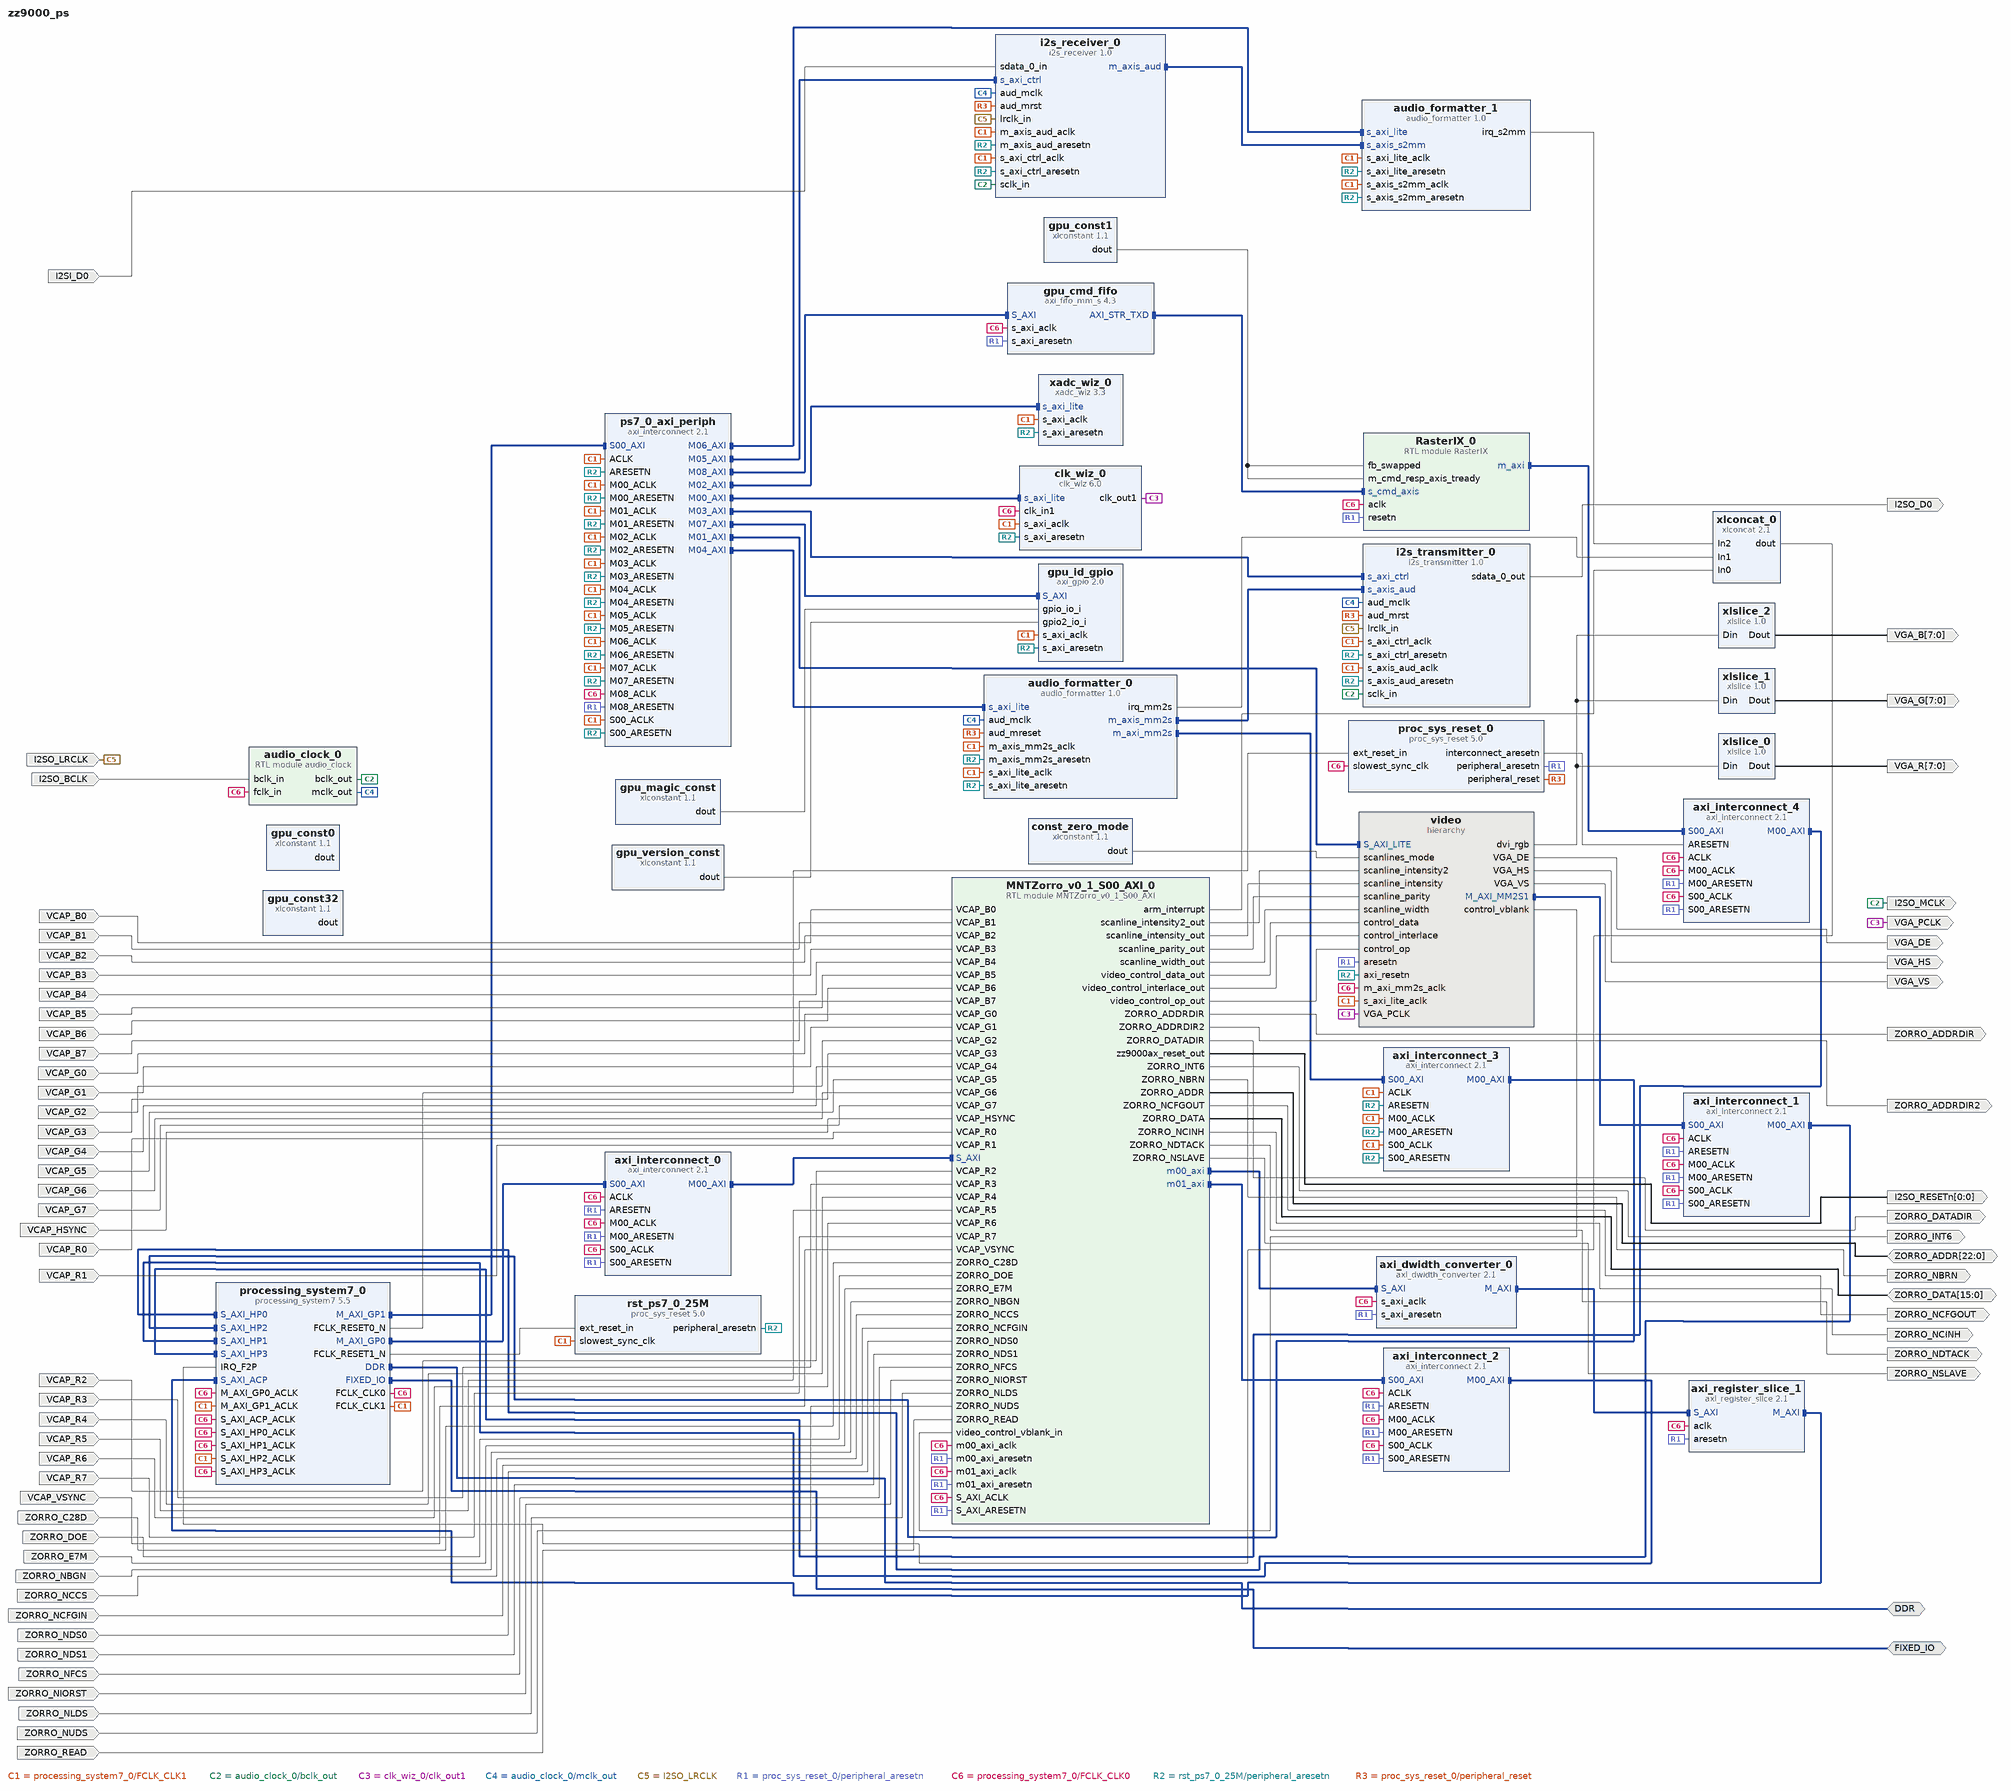
[diagram p0: block diagram of the top level]
# Vivado block design zz9000_ps, xc7z020clg400-1, Vivado 2025.2
create_bd_design zz9000_ps

create_bd_intf_port -mode Master -vlnv xilinx.com:interface:ddrx_rtl:1.0 DDR
create_bd_intf_port -mode Master -vlnv xilinx.com:display_processing_system7:fixedio_rtl:1.0 FIXED_IO
create_bd_port -dir I I2SI_D0
create_bd_port -dir I I2SO_BCLK
create_bd_port -dir O I2SO_D0
create_bd_port -dir I I2SO_LRCLK
create_bd_port -dir O -type clk I2SO_MCLK
set_property -dict {CONFIG.FREQ_HZ 20000000} [get_bd_ports I2SO_MCLK]
create_bd_port -dir O -from 0 -to 0 I2SO_RESETn
create_bd_port -dir I VCAP_B0
create_bd_port -dir I VCAP_B1
create_bd_port -dir I VCAP_B2
create_bd_port -dir I VCAP_B3
create_bd_port -dir I VCAP_B4
create_bd_port -dir I VCAP_B5
create_bd_port -dir I VCAP_B6
create_bd_port -dir I VCAP_B7
create_bd_port -dir I VCAP_G0
create_bd_port -dir I VCAP_G1
create_bd_port -dir I VCAP_G2
create_bd_port -dir I VCAP_G3
create_bd_port -dir I VCAP_G4
create_bd_port -dir I VCAP_G5
create_bd_port -dir I VCAP_G6
create_bd_port -dir I VCAP_G7
create_bd_port -dir I VCAP_HSYNC
create_bd_port -dir I VCAP_R0
create_bd_port -dir I VCAP_R1
create_bd_port -dir I VCAP_R2
create_bd_port -dir I VCAP_R3
create_bd_port -dir I VCAP_R4
create_bd_port -dir I VCAP_R5
create_bd_port -dir I VCAP_R6
create_bd_port -dir I VCAP_R7
create_bd_port -dir I VCAP_VSYNC
create_bd_port -dir O -from 7 -to 0 VGA_B
create_bd_port -dir O VGA_DE
create_bd_port -dir O -from 7 -to 0 VGA_G
create_bd_port -dir O VGA_HS
create_bd_port -dir O -type clk VGA_PCLK
create_bd_port -dir O -from 7 -to 0 VGA_R
create_bd_port -dir O VGA_VS
create_bd_port -dir IO -from 22 -to 0 ZORRO_ADDR
create_bd_port -dir O ZORRO_ADDRDIR
create_bd_port -dir O ZORRO_ADDRDIR2
create_bd_port -dir I ZORRO_C28D
create_bd_port -dir IO -from 15 -to 0 ZORRO_DATA
create_bd_port -dir O ZORRO_DATADIR
create_bd_port -dir I ZORRO_DOE
create_bd_port -dir I ZORRO_E7M
create_bd_port -dir O ZORRO_INT6
create_bd_port -dir I ZORRO_NBGN
create_bd_port -dir O ZORRO_NBRN
create_bd_port -dir I ZORRO_NCCS
create_bd_port -dir I ZORRO_NCFGIN
create_bd_port -dir O ZORRO_NCFGOUT
create_bd_port -dir O ZORRO_NCINH
create_bd_port -dir I ZORRO_NDS0
create_bd_port -dir I ZORRO_NDS1
create_bd_port -dir O ZORRO_NDTACK
create_bd_port -dir I ZORRO_NFCS
create_bd_port -dir I ZORRO_NIORST
create_bd_port -dir I ZORRO_NLDS
create_bd_port -dir O ZORRO_NSLAVE
create_bd_port -dir I ZORRO_NUDS
create_bd_port -dir I ZORRO_READ

create_bd_cell -type module -reference MNTZorro_v0_1_S00_AXI MNTZorro_v0_1_S00_AXI_0
create_bd_cell -type module -reference audio_clock audio_clock_0
create_bd_cell -type ip -vlnv xilinx.com:ip:audio_formatter:1.0 audio_formatter_0
set_property -dict [list \
  CONFIG.C_INCLUDE_MM2S 1 \
  CONFIG.C_INCLUDE_S2MM 0 \
  CONFIG.C_MM2S_ADDR_WIDTH 32 \
  CONFIG.C_MM2S_ASYNC_CLOCK 0 \
  CONFIG.C_MM2S_DATAFORMAT 3 \
] [get_bd_cells audio_formatter_0]
create_bd_cell -type ip -vlnv xilinx.com:ip:audio_formatter:1.0 audio_formatter_1
set_property -dict [list \
  CONFIG.C_INCLUDE_MM2S 0 \
  CONFIG.C_S2MM_ADDR_WIDTH 32 \
  CONFIG.C_S2MM_ASYNC_CLOCK 0 \
] [get_bd_cells audio_formatter_1]
create_bd_cell -type ip -vlnv xilinx.com:ip:axi_dwidth_converter:2.1 axi_dwidth_converter_0
create_bd_cell -type ip -vlnv xilinx.com:ip:axi_interconnect:2.1 axi_interconnect_0
set_property -dict {CONFIG.NUM_MI 1 CONFIG.S00_HAS_REGSLICE 3} [get_bd_cells axi_interconnect_0]
create_bd_cell -type ip -vlnv xilinx.com:ip:axi_interconnect:2.1 axi_interconnect_1
set_property -dict {CONFIG.NUM_MI 1 CONFIG.S00_HAS_REGSLICE 4} [get_bd_cells axi_interconnect_1]
create_bd_cell -type ip -vlnv xilinx.com:ip:axi_interconnect:2.1 axi_interconnect_2
set_property -dict {CONFIG.NUM_MI 1 CONFIG.S00_HAS_REGSLICE 3} [get_bd_cells axi_interconnect_2]
create_bd_cell -type ip -vlnv xilinx.com:ip:axi_interconnect:2.1 axi_interconnect_3
set_property -dict [list \
  CONFIG.ENABLE_ADVANCED_OPTIONS 0 \
  CONFIG.NUM_MI 1 \
  CONFIG.NUM_SI 1 \
  CONFIG.S00_HAS_REGSLICE 0 \
] [get_bd_cells axi_interconnect_3]
create_bd_cell -type ip -vlnv xilinx.com:ip:axi_interconnect:2.1 axi_interconnect_4
set_property -dict {CONFIG.NUM_MI 1 CONFIG.NUM_SI 1} [get_bd_cells axi_interconnect_4]
create_bd_cell -type ip -vlnv xilinx.com:ip:axi_register_slice:2.1 axi_register_slice_1
set_property -dict {CONFIG.PROTOCOL AXI3 CONFIG.REG_AR 7 CONFIG.REG_AW 7 CONFIG.REG_B 7} [get_bd_cells axi_register_slice_1]
create_bd_cell -type ip -vlnv xilinx.com:ip:clk_wiz:6.0 clk_wiz_0
set_property -dict [list \
  CONFIG.CLKOUT1_DRIVES BUFG \
  CONFIG.CLKOUT1_JITTER 272.433 \
  CONFIG.CLKOUT1_PHASE_ERROR 261.747 \
  CONFIG.CLKOUT1_REQUESTED_OUT_FREQ 75 \
  CONFIG.CLKOUT2_DRIVES BUFG \
  CONFIG.CLKOUT3_DRIVES BUFG \
  CONFIG.CLKOUT4_DRIVES BUFG \
  CONFIG.CLKOUT5_DRIVES BUFG \
  CONFIG.CLKOUT6_DRIVES BUFG \
  CONFIG.CLKOUT7_DRIVES BUFG \
  CONFIG.MMCM_CLKFBOUT_MULT_F 33 \
  CONFIG.MMCM_CLKOUT0_DIVIDE_F 11 \
  CONFIG.MMCM_COMPENSATION ZHOLD \
  CONFIG.MMCM_DIVCLK_DIVIDE 4 \
  CONFIG.PRIMITIVE PLL \
  CONFIG.PRIM_SOURCE Single_ended_clock_capable_pin \
  CONFIG.SECONDARY_SOURCE Single_ended_clock_capable_pin \
  CONFIG.USE_DYN_RECONFIG true \
  CONFIG.USE_PHASE_ALIGNMENT false \
] [get_bd_cells clk_wiz_0]
create_bd_cell -type ip -vlnv xilinx.com:ip:i2s_receiver:1.0 i2s_receiver_0
set_property -dict {CONFIG.C_DWIDTH 16 CONFIG.C_IS_MASTER 0} [get_bd_cells i2s_receiver_0]
create_bd_cell -type ip -vlnv xilinx.com:ip:i2s_transmitter:1.0 i2s_transmitter_0
set_property -dict {CONFIG.C_DWIDTH 16 CONFIG.C_IS_MASTER 0} [get_bd_cells i2s_transmitter_0]
create_bd_cell -type ip -vlnv xilinx.com:ip:proc_sys_reset:5.0 proc_sys_reset_0
create_bd_cell -type ip -vlnv xilinx.com:ip:processing_system7:5.5 processing_system7_0
set_property -dict [list \
  CONFIG.PCW_APU_PERIPHERAL_FREQMHZ 666.666 \
  CONFIG.PCW_ENET0_ENET0_IO {MIO 16 .. 27} \
  CONFIG.PCW_ENET0_GRP_MDIO_ENABLE 1 \
  CONFIG.PCW_ENET0_GRP_MDIO_IO {MIO 52 .. 53} \
  CONFIG.PCW_ENET0_PERIPHERAL_ENABLE 1 \
  CONFIG.PCW_ENET_RESET_ENABLE 0 \
  CONFIG.PCW_EN_CLK1_PORT 1 \
  CONFIG.PCW_EN_RST1_PORT 1 \
  CONFIG.PCW_FCLK_CLK1_BUF TRUE \
  CONFIG.PCW_FPGA0_PERIPHERAL_FREQMHZ 100 \
  CONFIG.PCW_FPGA1_PERIPHERAL_FREQMHZ 25 \
  CONFIG.PCW_FPGA_FCLK1_ENABLE 1 \
  CONFIG.PCW_GPIO_MIO_GPIO_ENABLE 1 \
  CONFIG.PCW_GPIO_MIO_GPIO_IO MIO \
  CONFIG.PCW_I2C0_GRP_INT_ENABLE 0 \
  CONFIG.PCW_I2C0_I2C0_IO {MIO 50 .. 51} \
  CONFIG.PCW_I2C0_PERIPHERAL_ENABLE 1 \
  CONFIG.PCW_I2C1_GRP_INT_ENABLE 1 \
  CONFIG.PCW_I2C1_GRP_INT_IO EMIO \
  CONFIG.PCW_I2C1_I2C1_IO {MIO 12 .. 13} \
  CONFIG.PCW_I2C1_PERIPHERAL_ENABLE 1 \
  CONFIG.PCW_I2C_PERIPHERAL_FREQMHZ 111.111115 \
  CONFIG.PCW_I2C_RESET_ENABLE 0 \
  CONFIG.PCW_IRQ_F2P_INTR 1 \
  CONFIG.PCW_PERIPHERAL_BOARD_PRESET None \
  CONFIG.PCW_PRESET_BANK1_VOLTAGE {LVCMOS 1.8V} \
  CONFIG.PCW_QSPI_PERIPHERAL_ENABLE 0 \
  CONFIG.PCW_SD0_GRP_CD_ENABLE 0 \
  CONFIG.PCW_SD0_GRP_WP_ENABLE 0 \
  CONFIG.PCW_SD0_PERIPHERAL_ENABLE 1 \
  CONFIG.PCW_SD0_SD0_IO {MIO 40 .. 45} \
  CONFIG.PCW_SDIO_PERIPHERAL_FREQMHZ 25 \
  CONFIG.PCW_S_AXI_HP0_DATA_WIDTH 32 \
  CONFIG.PCW_S_AXI_HP1_DATA_WIDTH 32 \
  CONFIG.PCW_S_AXI_HP2_DATA_WIDTH 32 \
  CONFIG.PCW_UART1_PERIPHERAL_ENABLE 1 \
  CONFIG.PCW_UART1_UART1_IO {MIO 48 .. 49} \
  CONFIG.PCW_UART_PERIPHERAL_FREQMHZ 100 \
  CONFIG.PCW_UIPARAM_DDR_FREQ_MHZ 533.333 \
  CONFIG.PCW_UIPARAM_DDR_PARTNO {MT41J256M16 RE-125} \
  CONFIG.PCW_UIPARAM_GENERATE_SUMMARY NONE \
  CONFIG.PCW_USB0_PERIPHERAL_ENABLE 1 \
  CONFIG.PCW_USB0_USB0_IO {MIO 28 .. 39} \
  CONFIG.PCW_USB_RESET_ENABLE 0 \
  CONFIG.PCW_USE_DEFAULT_ACP_USER_VAL 1 \
  CONFIG.PCW_USE_FABRIC_INTERRUPT 1 \
  CONFIG.PCW_USE_M_AXI_GP1 1 \
  CONFIG.PCW_USE_S_AXI_ACP 1 \
  CONFIG.PCW_USE_S_AXI_HP0 1 \
  CONFIG.PCW_USE_S_AXI_HP1 1 \
  CONFIG.PCW_USE_S_AXI_HP2 1 \
  CONFIG.PCW_USE_S_AXI_HP3 1 \
  CONFIG.preset None \
] [get_bd_cells processing_system7_0]
# 514 more settings of processing_system7_0 are not shown: defaults, MIO pin electricals, DDR timing, and values the tool derives
create_bd_cell -type ip -vlnv xilinx.com:ip:axi_interconnect:2.1 ps7_0_axi_periph
set_property -dict [list \
  CONFIG.M00_HAS_DATA_FIFO 0 \
  CONFIG.M00_HAS_REGSLICE 3 \
  CONFIG.M01_HAS_DATA_FIFO 0 \
  CONFIG.M01_HAS_REGSLICE 3 \
  CONFIG.NUM_MI 9 \
  CONFIG.S00_HAS_DATA_FIFO 0 \
  CONFIG.S00_HAS_REGSLICE 3 \
] [get_bd_cells ps7_0_axi_periph]
create_bd_cell -type ip -vlnv xilinx.com:ip:proc_sys_reset:5.0 rst_ps7_0_25M
set_property -dict {CONFIG.C_NUM_INTERCONNECT_ARESETN 1 CONFIG.C_NUM_PERP_ARESETN 1} [get_bd_cells rst_ps7_0_25M]
create_bd_cell -type hier video
create_bd_cell -type ip -vlnv xilinx.com:ip:xadc_wiz:3.3 xadc_wiz_0
set_property -dict [list \
  CONFIG.AVERAGE_ENABLE_TEMPERATURE true \
  CONFIG.AVERAGE_ENABLE_VBRAM true \
  CONFIG.AVERAGE_ENABLE_VCCAUX true \
  CONFIG.AVERAGE_ENABLE_VCCDDRO true \
  CONFIG.AVERAGE_ENABLE_VCCINT true \
  CONFIG.AVERAGE_ENABLE_VCCPAUX true \
  CONFIG.AVERAGE_ENABLE_VCCPINT true \
  CONFIG.CHANNEL_ENABLE_TEMPERATURE true \
  CONFIG.CHANNEL_ENABLE_VBRAM true \
  CONFIG.CHANNEL_ENABLE_VCCAUX true \
  CONFIG.CHANNEL_ENABLE_VCCDDRO true \
  CONFIG.CHANNEL_ENABLE_VCCINT true \
  CONFIG.CHANNEL_ENABLE_VCCPAUX true \
  CONFIG.CHANNEL_ENABLE_VCCPINT true \
  CONFIG.CHANNEL_ENABLE_VP_VN false \
  CONFIG.ENABLE_VCCDDRO_ALARM false \
  CONFIG.ENABLE_VCCPAUX_ALARM false \
  CONFIG.ENABLE_VCCPINT_ALARM false \
  CONFIG.EXTERNAL_MUX_CHANNEL VP_VN \
  CONFIG.SEQUENCER_MODE Off \
  CONFIG.SINGLE_CHANNEL_SELECTION TEMPERATURE \
  CONFIG.TEMPERATURE_ALARM_OT_TRIGGER 80 \
  CONFIG.TEMPERATURE_ALARM_TRIGGER 85.0 \
  CONFIG.TIMING_MODE Continuous \
  CONFIG.USER_TEMP_ALARM false \
  CONFIG.VCCAUX_ALARM false \
  CONFIG.VCCINT_ALARM false \
  CONFIG.XADC_STARUP_SELECTION simultaneous_sampling \
] [get_bd_cells xadc_wiz_0]
create_bd_cell -type ip -vlnv xilinx.com:ip:xlconcat:2.1 xlconcat_0
set_property -dict {CONFIG.NUM_PORTS 3} [get_bd_cells xlconcat_0]
create_bd_cell -type ip -vlnv xilinx.com:ip:xlslice:1.0 xlslice_0
set_property -dict {CONFIG.DIN_FROM 23 CONFIG.DIN_TO 16 CONFIG.DIN_WIDTH 32 CONFIG.DOUT_WIDTH 8} [get_bd_cells xlslice_0]
create_bd_cell -type ip -vlnv xilinx.com:ip:xlslice:1.0 xlslice_1
set_property -dict {CONFIG.DIN_FROM 15 CONFIG.DIN_TO 8 CONFIG.DIN_WIDTH 32 CONFIG.DOUT_WIDTH 8} [get_bd_cells xlslice_1]
create_bd_cell -type ip -vlnv xilinx.com:ip:xlslice:1.0 xlslice_2
set_property -dict {CONFIG.DIN_FROM 7 CONFIG.DIN_TO 0 CONFIG.DIN_WIDTH 32 CONFIG.DOUT_WIDTH 8} [get_bd_cells xlslice_2]
create_bd_cell -type ip -vlnv xilinx.com:ip:xlconstant:1.1 const_zero_mode
set_property -dict {CONFIG.CONST_VAL 0 CONFIG.CONST_WIDTH 1} [get_bd_cells const_zero_mode]
create_bd_cell -type module -reference RasterIX RasterIX_0
set_property -dict [list \
  CONFIG.ADDR_WIDTH 32 \
  CONFIG.DATA_WIDTH 64 \
  CONFIG.ENABLE_MEMORY_COALESCING 1 \
  CONFIG.ID_WIDTH 6 \
  CONFIG.RASTERIZER_ENABLE_FLOAT_INTERPOLATION 0 \
  CONFIG.RASTERIZER_FIXPOINT_PRECISION 18 \
  CONFIG.RASTERIZER_FLOAT_PRECISION 24 \
  CONFIG.STRB_WIDTH 8 \
  CONFIG.SUB_PIXEL_CALC_PRECISION 8 \
  CONFIG.TEXTURE_PAGE_SIZE 2048 \
  CONFIG.TMU_COUNT 1 \
  CONFIG.VARIANT ef \
] [get_bd_cells RasterIX_0]
create_bd_cell -type ip -vlnv xilinx.com:ip:xlconstant:1.1 gpu_const0
set_property -dict {CONFIG.CONST_VAL 0 CONFIG.CONST_WIDTH 1} [get_bd_cells gpu_const0]
create_bd_cell -type ip -vlnv xilinx.com:ip:xlconstant:1.1 gpu_const1
set_property -dict {CONFIG.CONST_VAL 1 CONFIG.CONST_WIDTH 1} [get_bd_cells gpu_const1]
create_bd_cell -type ip -vlnv xilinx.com:ip:xlconstant:1.1 gpu_const32
set_property -dict {CONFIG.CONST_VAL 0 CONFIG.CONST_WIDTH 32} [get_bd_cells gpu_const32]
create_bd_cell -type ip -vlnv xilinx.com:ip:axi_gpio:2.0 gpu_id_gpio
set_property -dict [list \
  CONFIG.C_ALL_INPUTS 1 \
  CONFIG.C_ALL_INPUTS_2 1 \
  CONFIG.C_GPIO2_WIDTH 32 \
  CONFIG.C_GPIO_WIDTH 32 \
  CONFIG.C_INTERRUPT_PRESENT 0 \
  CONFIG.C_IS_DUAL 1 \
] [get_bd_cells gpu_id_gpio]
create_bd_cell -type ip -vlnv xilinx.com:ip:xlconstant:1.1 gpu_magic_const
set_property -dict {CONFIG.CONST_VAL 0x52495831 CONFIG.CONST_WIDTH 32} [get_bd_cells gpu_magic_const]
create_bd_cell -type ip -vlnv xilinx.com:ip:xlconstant:1.1 gpu_version_const
set_property -dict {CONFIG.CONST_VAL 131072 CONFIG.CONST_WIDTH 32} [get_bd_cells gpu_version_const]
create_bd_cell -type ip -vlnv xilinx.com:ip:axi_fifo_mm_s:4.3 gpu_cmd_fifo
set_property -dict [list \
  CONFIG.C_DATA_INTERFACE_TYPE 0 \
  CONFIG.C_TX_FIFO_DEPTH 512 \
  CONFIG.C_TX_FIFO_PE_THRESHOLD 5 \
  CONFIG.C_TX_FIFO_PF_THRESHOLD 507 \
  CONFIG.C_USE_RX_DATA 0 \
  CONFIG.C_USE_TX_CTRL 0 \
  CONFIG.C_USE_TX_DATA 1 \
] [get_bd_cells gpu_cmd_fifo]

# ---- hierarchy /video ----
current_bd_instance /video
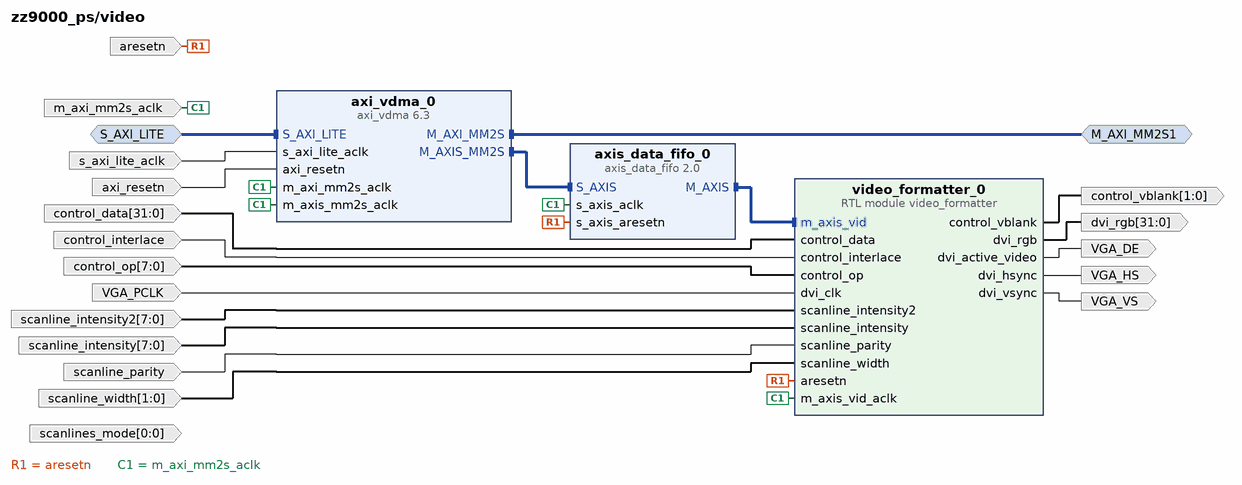
[diagram p1: block diagram inside /video]
create_bd_intf_pin -mode Master -vlnv xilinx.com:interface:aximm_rtl:1.0 M_AXI_MM2S1
create_bd_intf_pin -mode Slave -vlnv xilinx.com:interface:aximm_rtl:1.0 S_AXI_LITE
create_bd_pin -dir O VGA_DE
create_bd_pin -dir O VGA_HS
create_bd_pin -dir I -type clk VGA_PCLK
create_bd_pin -dir O VGA_VS
create_bd_pin -dir I -type rst aresetn
create_bd_pin -dir I -type rst axi_resetn
create_bd_pin -dir I -from 31 -to 0 control_data
create_bd_pin -dir I control_interlace
create_bd_pin -dir I -from 7 -to 0 control_op
create_bd_pin -dir O -from 1 -to 0 control_vblank
create_bd_pin -dir O -from 31 -to 0 dvi_rgb
create_bd_pin -dir I -from 0 -to 0 scanlines_mode
create_bd_pin -dir I -type clk m_axi_mm2s_aclk
create_bd_pin -dir I -type clk s_axi_lite_aclk
create_bd_pin -dir I -from 7 -to 0 scanline_intensity
create_bd_pin -dir I -from 7 -to 0 scanline_intensity2
create_bd_pin -dir I -from 1 -to 0 scanline_width
create_bd_pin -dir I scanline_parity

create_bd_cell -type ip -vlnv xilinx.com:ip:axi_vdma:6.3 axi_vdma_0
set_property -dict [list \
  CONFIG.c_include_mm2s_dre 1 \
  CONFIG.c_include_s2mm 0 \
  CONFIG.c_m_axi_mm2s_data_width 32 \
  CONFIG.c_mm2s_genlock_mode 0 \
  CONFIG.c_mm2s_linebuffer_depth 512 \
  CONFIG.c_mm2s_max_burst_length 128 \
  CONFIG.c_num_fstores 1 \
] [get_bd_cells axi_vdma_0]
create_bd_cell -type ip -vlnv xilinx.com:ip:axis_data_fifo:2.0 axis_data_fifo_0
set_property -dict {CONFIG.FIFO_DEPTH 32 CONFIG.FIFO_MEMORY_TYPE auto} [get_bd_cells axis_data_fifo_0]
create_bd_cell -type module -reference video_formatter video_formatter_0

# ---- connections ----

current_bd_instance /video
connect_bd_intf_net [get_bd_intf_pins M_AXI_MM2S1] [get_bd_intf_pins axi_vdma_0/M_AXI_MM2S]
connect_bd_intf_net [get_bd_intf_pins axi_vdma_0/M_AXIS_MM2S] [get_bd_intf_pins axis_data_fifo_0/S_AXIS]
connect_bd_intf_net [get_bd_intf_pins axis_data_fifo_0/M_AXIS] [get_bd_intf_pins video_formatter_0/m_axis_vid]
connect_bd_intf_net [get_bd_intf_pins S_AXI_LITE] [get_bd_intf_pins axi_vdma_0/S_AXI_LITE]
# net MNTZorro_v0_1_S00_AXI_0_scanlines_mode has one end: scanlines_mode
connect_bd_net -net MNTZorro_v0_1_S00_AXI_0_video_control_data [get_bd_pins control_data] [get_bd_pins video_formatter_0/control_data]
connect_bd_net -net MNTZorro_v0_1_S00_AXI_0_video_control_interlace [get_bd_pins control_interlace] [get_bd_pins video_formatter_0/control_interlace]
connect_bd_net -net MNTZorro_v0_1_S00_AXI_0_video_control_op [get_bd_pins control_op] [get_bd_pins video_formatter_0/control_op]
connect_bd_net -net clk_1 [get_bd_pins VGA_PCLK] [get_bd_pins video_formatter_0/dvi_clk]
connect_bd_net -net proc_sys_reset_1_peripheral_aresetn [get_bd_pins aresetn] \
  [get_bd_pins axis_data_fifo_0/s_axis_aresetn] [get_bd_pins video_formatter_0/aresetn]
connect_bd_net -net processing_system7_0_FCLK_CLK0 [get_bd_pins m_axi_mm2s_aclk] \
  [get_bd_pins axi_vdma_0/m_axi_mm2s_aclk] [get_bd_pins axi_vdma_0/m_axis_mm2s_aclk] \
  [get_bd_pins axis_data_fifo_0/s_axis_aclk] [get_bd_pins video_formatter_0/m_axis_vid_aclk]
connect_bd_net -net processing_system7_0_FCLK_CLK1 [get_bd_pins s_axi_lite_aclk] [get_bd_pins axi_vdma_0/s_axi_lite_aclk]
connect_bd_net -net rst_ps7_0_25M_peripheral_aresetn [get_bd_pins axi_resetn] [get_bd_pins axi_vdma_0/axi_resetn]
connect_bd_net -net scanline_intensity2_1 [get_bd_pins scanline_intensity2] [get_bd_pins video_formatter_0/scanline_intensity2]
connect_bd_net [get_bd_pins scanline_intensity] [get_bd_pins video_formatter_0/scanline_intensity]
connect_bd_net [get_bd_pins scanline_parity] [get_bd_pins video_formatter_0/scanline_parity]
connect_bd_net [get_bd_pins scanline_width] [get_bd_pins video_formatter_0/scanline_width]
connect_bd_net -net v_axi4s_vid_out_0_vid_data [get_bd_pins video_formatter_0/dvi_rgb] [get_bd_pins dvi_rgb]
connect_bd_net [get_bd_pins video_formatter_0/control_vblank] [get_bd_pins control_vblank]
connect_bd_net -net video_subsystem_VGA_DE [get_bd_pins video_formatter_0/dvi_active_video] [get_bd_pins VGA_DE]
connect_bd_net -net video_subsystem_VGA_HS [get_bd_pins video_formatter_0/dvi_hsync] [get_bd_pins VGA_HS]
connect_bd_net -net video_subsystem_VGA_VS [get_bd_pins video_formatter_0/dvi_vsync] [get_bd_pins VGA_VS]

current_bd_instance /
connect_bd_intf_net [get_bd_intf_pins MNTZorro_v0_1_S00_AXI_0/m00_axi] [get_bd_intf_pins axi_dwidth_converter_0/S_AXI]
connect_bd_intf_net [get_bd_intf_pins axi_interconnect_0/S00_AXI] [get_bd_intf_pins processing_system7_0/M_AXI_GP0]
connect_bd_intf_net [get_bd_intf_pins processing_system7_0/M_AXI_GP1] [get_bd_intf_pins ps7_0_axi_periph/S00_AXI]
connect_bd_intf_net [get_bd_intf_pins axi_interconnect_1/S00_AXI] [get_bd_intf_pins video/M_AXI_MM2S1]
connect_bd_intf_net [get_bd_intf_pins MNTZorro_v0_1_S00_AXI_0/m01_axi] [get_bd_intf_pins axi_interconnect_2/S00_AXI]
connect_bd_intf_net [get_bd_intf_pins RasterIX_0/m_axi] [get_bd_intf_pins axi_interconnect_4/S00_AXI]
connect_bd_intf_net [get_bd_intf_pins audio_formatter_0/m_axi_mm2s] [get_bd_intf_pins axi_interconnect_3/S00_AXI]
connect_bd_intf_net [get_bd_intf_pins audio_formatter_0/m_axis_mm2s] [get_bd_intf_pins i2s_transmitter_0/s_axis_aud]
connect_bd_intf_net [get_bd_intf_pins axi_dwidth_converter_0/M_AXI] [get_bd_intf_pins axi_register_slice_1/S_AXI]
connect_bd_intf_net [get_bd_intf_pins MNTZorro_v0_1_S00_AXI_0/S_AXI] [get_bd_intf_pins axi_interconnect_0/M00_AXI]
connect_bd_intf_net [get_bd_intf_pins axi_interconnect_1/M00_AXI] [get_bd_intf_pins processing_system7_0/S_AXI_HP0]
connect_bd_intf_net [get_bd_intf_pins axi_interconnect_2/M00_AXI] [get_bd_intf_pins processing_system7_0/S_AXI_HP1]
connect_bd_intf_net [get_bd_intf_pins axi_interconnect_3/M00_AXI] [get_bd_intf_pins processing_system7_0/S_AXI_HP2]
connect_bd_intf_net [get_bd_intf_pins axi_interconnect_4/M00_AXI] [get_bd_intf_pins processing_system7_0/S_AXI_HP3]
connect_bd_intf_net [get_bd_intf_pins axi_register_slice_1/M_AXI] [get_bd_intf_pins processing_system7_0/S_AXI_ACP]
connect_bd_intf_net [get_bd_intf_pins gpu_cmd_fifo/AXI_STR_TXD] [get_bd_intf_pins RasterIX_0/s_cmd_axis]
connect_bd_intf_net [get_bd_intf_pins audio_formatter_1/s_axis_s2mm] [get_bd_intf_pins i2s_receiver_0/m_axis_aud]
connect_bd_intf_net [get_bd_intf_ports DDR] [get_bd_intf_pins processing_system7_0/DDR]
connect_bd_intf_net [get_bd_intf_ports FIXED_IO] [get_bd_intf_pins processing_system7_0/FIXED_IO]
connect_bd_intf_net [get_bd_intf_pins clk_wiz_0/s_axi_lite] [get_bd_intf_pins ps7_0_axi_periph/M00_AXI]
connect_bd_intf_net [get_bd_intf_pins ps7_0_axi_periph/M01_AXI] [get_bd_intf_pins video/S_AXI_LITE]
connect_bd_intf_net [get_bd_intf_pins ps7_0_axi_periph/M02_AXI] [get_bd_intf_pins xadc_wiz_0/s_axi_lite]
connect_bd_intf_net [get_bd_intf_pins i2s_transmitter_0/s_axi_ctrl] [get_bd_intf_pins ps7_0_axi_periph/M03_AXI]
connect_bd_intf_net [get_bd_intf_pins audio_formatter_0/s_axi_lite] [get_bd_intf_pins ps7_0_axi_periph/M04_AXI]
connect_bd_intf_net [get_bd_intf_pins i2s_receiver_0/s_axi_ctrl] [get_bd_intf_pins ps7_0_axi_periph/M05_AXI]
connect_bd_intf_net [get_bd_intf_pins audio_formatter_1/s_axi_lite] [get_bd_intf_pins ps7_0_axi_periph/M06_AXI]
connect_bd_intf_net [get_bd_intf_pins ps7_0_axi_periph/M07_AXI] [get_bd_intf_pins gpu_id_gpio/S_AXI]
connect_bd_intf_net [get_bd_intf_pins ps7_0_axi_periph/M08_AXI] [get_bd_intf_pins gpu_cmd_fifo/S_AXI]
connect_bd_net [get_bd_ports I2SO_BCLK] [get_bd_pins audio_clock_0/bclk_in]
connect_bd_net [get_bd_pins MNTZorro_v0_1_S00_AXI_0/ZORRO_ADDRDIR] [get_bd_ports ZORRO_ADDRDIR]
connect_bd_net [get_bd_pins MNTZorro_v0_1_S00_AXI_0/ZORRO_ADDRDIR2] [get_bd_ports ZORRO_ADDRDIR2]
connect_bd_net [get_bd_pins MNTZorro_v0_1_S00_AXI_0/ZORRO_DATADIR] [get_bd_ports ZORRO_DATADIR]
connect_bd_net [get_bd_pins MNTZorro_v0_1_S00_AXI_0/ZORRO_INT6] [get_bd_ports ZORRO_INT6]
connect_bd_net [get_bd_pins MNTZorro_v0_1_S00_AXI_0/ZORRO_NBRN] [get_bd_ports ZORRO_NBRN]
connect_bd_net [get_bd_pins MNTZorro_v0_1_S00_AXI_0/ZORRO_NCFGOUT] [get_bd_ports ZORRO_NCFGOUT]
connect_bd_net [get_bd_pins MNTZorro_v0_1_S00_AXI_0/ZORRO_NCINH] [get_bd_ports ZORRO_NCINH]
connect_bd_net [get_bd_pins MNTZorro_v0_1_S00_AXI_0/ZORRO_NDTACK] [get_bd_ports ZORRO_NDTACK]
connect_bd_net [get_bd_pins MNTZorro_v0_1_S00_AXI_0/ZORRO_NSLAVE] [get_bd_ports ZORRO_NSLAVE]
connect_bd_net [get_bd_pins MNTZorro_v0_1_S00_AXI_0/arm_interrupt] [get_bd_pins xlconcat_0/In0]
connect_bd_net [get_bd_pins MNTZorro_v0_1_S00_AXI_0/scanline_intensity2_out] [get_bd_pins video/scanline_intensity2]
connect_bd_net [get_bd_pins MNTZorro_v0_1_S00_AXI_0/scanline_intensity_out] [get_bd_pins video/scanline_intensity]
connect_bd_net [get_bd_pins MNTZorro_v0_1_S00_AXI_0/scanline_parity_out] [get_bd_pins video/scanline_parity]
connect_bd_net [get_bd_pins MNTZorro_v0_1_S00_AXI_0/scanline_width_out] [get_bd_pins video/scanline_width]
connect_bd_net -net MNTZorro_v0_1_S00_AXI_0_video_control_data [get_bd_pins MNTZorro_v0_1_S00_AXI_0/video_control_data_out] \
  [get_bd_pins video/control_data]
connect_bd_net -net MNTZorro_v0_1_S00_AXI_0_video_control_interlace [get_bd_pins MNTZorro_v0_1_S00_AXI_0/video_control_interlace_out] \
  [get_bd_pins video/control_interlace]
connect_bd_net -net MNTZorro_v0_1_S00_AXI_0_video_control_op [get_bd_pins MNTZorro_v0_1_S00_AXI_0/video_control_op_out] [get_bd_pins video/control_op]
connect_bd_net -net MNTZorro_v0_1_S00_AXI_0_zz900ax_reset_out [get_bd_pins MNTZorro_v0_1_S00_AXI_0/zz9000ax_reset_out] [get_bd_ports I2SO_RESETn]
connect_bd_net [get_bd_ports ZORRO_ADDR] [get_bd_pins MNTZorro_v0_1_S00_AXI_0/ZORRO_ADDR]
connect_bd_net [get_bd_ports ZORRO_DATA] [get_bd_pins MNTZorro_v0_1_S00_AXI_0/ZORRO_DATA]
connect_bd_net -net S00_ACLK_1 [get_bd_pins processing_system7_0/FCLK_CLK1] \
  [get_bd_pins audio_formatter_0/m_axis_mm2s_aclk] [get_bd_pins audio_formatter_0/s_axi_lite_aclk] \
  [get_bd_pins audio_formatter_1/s_axi_lite_aclk] [get_bd_pins audio_formatter_1/s_axis_s2mm_aclk] \
  [get_bd_pins axi_interconnect_3/ACLK] [get_bd_pins axi_interconnect_3/M00_ACLK] [get_bd_pins axi_interconnect_3/S00_ACLK] \
  [get_bd_pins clk_wiz_0/s_axi_aclk] [get_bd_pins i2s_receiver_0/m_axis_aud_aclk] \
  [get_bd_pins i2s_receiver_0/s_axi_ctrl_aclk] [get_bd_pins i2s_transmitter_0/s_axi_ctrl_aclk] \
  [get_bd_pins i2s_transmitter_0/s_axis_aud_aclk] [get_bd_pins processing_system7_0/M_AXI_GP1_ACLK] \
  [get_bd_pins processing_system7_0/S_AXI_HP2_ACLK] [get_bd_pins ps7_0_axi_periph/ACLK] \
  [get_bd_pins ps7_0_axi_periph/M00_ACLK] [get_bd_pins ps7_0_axi_periph/M01_ACLK] [get_bd_pins ps7_0_axi_periph/M02_ACLK] \
  [get_bd_pins ps7_0_axi_periph/M03_ACLK] [get_bd_pins ps7_0_axi_periph/M04_ACLK] [get_bd_pins ps7_0_axi_periph/M05_ACLK] \
  [get_bd_pins ps7_0_axi_periph/M06_ACLK] [get_bd_pins ps7_0_axi_periph/S00_ACLK] \
  [get_bd_pins rst_ps7_0_25M/slowest_sync_clk] [get_bd_pins video/s_axi_lite_aclk] [get_bd_pins xadc_wiz_0/s_axi_aclk] \
  [get_bd_pins ps7_0_axi_periph/M07_ACLK] [get_bd_pins gpu_id_gpio/s_axi_aclk]
connect_bd_net -net VCAP_B0_0_1 [get_bd_ports VCAP_B0] [get_bd_pins MNTZorro_v0_1_S00_AXI_0/VCAP_B0]
connect_bd_net -net VCAP_B1_0_1 [get_bd_ports VCAP_B1] [get_bd_pins MNTZorro_v0_1_S00_AXI_0/VCAP_B1]
connect_bd_net -net VCAP_B2_0_1 [get_bd_ports VCAP_B2] [get_bd_pins MNTZorro_v0_1_S00_AXI_0/VCAP_B2]
connect_bd_net -net VCAP_B3_0_1 [get_bd_ports VCAP_B3] [get_bd_pins MNTZorro_v0_1_S00_AXI_0/VCAP_B3]
connect_bd_net -net VCAP_B4_0_1 [get_bd_ports VCAP_B4] [get_bd_pins MNTZorro_v0_1_S00_AXI_0/VCAP_B4]
connect_bd_net -net VCAP_B5_0_1 [get_bd_ports VCAP_B5] [get_bd_pins MNTZorro_v0_1_S00_AXI_0/VCAP_B5]
connect_bd_net -net VCAP_B6_0_1 [get_bd_ports VCAP_B6] [get_bd_pins MNTZorro_v0_1_S00_AXI_0/VCAP_B6]
connect_bd_net -net VCAP_B7_0_1 [get_bd_ports VCAP_B7] [get_bd_pins MNTZorro_v0_1_S00_AXI_0/VCAP_B7]
connect_bd_net -net VCAP_G0_0_1 [get_bd_ports VCAP_G0] [get_bd_pins MNTZorro_v0_1_S00_AXI_0/VCAP_G0]
connect_bd_net -net VCAP_G1_0_1 [get_bd_ports VCAP_G1] [get_bd_pins MNTZorro_v0_1_S00_AXI_0/VCAP_G1]
connect_bd_net -net VCAP_G2_0_1 [get_bd_ports VCAP_G2] [get_bd_pins MNTZorro_v0_1_S00_AXI_0/VCAP_G2]
connect_bd_net -net VCAP_G3_0_1 [get_bd_ports VCAP_G3] [get_bd_pins MNTZorro_v0_1_S00_AXI_0/VCAP_G3]
connect_bd_net -net VCAP_G4_0_1 [get_bd_ports VCAP_G4] [get_bd_pins MNTZorro_v0_1_S00_AXI_0/VCAP_G4]
connect_bd_net -net VCAP_G5_0_1 [get_bd_ports VCAP_G5] [get_bd_pins MNTZorro_v0_1_S00_AXI_0/VCAP_G5]
connect_bd_net -net VCAP_G6_0_1 [get_bd_ports VCAP_G6] [get_bd_pins MNTZorro_v0_1_S00_AXI_0/VCAP_G6]
connect_bd_net -net VCAP_G7_0_1 [get_bd_ports VCAP_G7] [get_bd_pins MNTZorro_v0_1_S00_AXI_0/VCAP_G7]
connect_bd_net -net VCAP_HSYNC_0_1 [get_bd_ports VCAP_HSYNC] [get_bd_pins MNTZorro_v0_1_S00_AXI_0/VCAP_HSYNC]
connect_bd_net -net VCAP_R0_0_1 [get_bd_ports VCAP_R0] [get_bd_pins MNTZorro_v0_1_S00_AXI_0/VCAP_R0]
connect_bd_net -net VCAP_R1_0_1 [get_bd_ports VCAP_R1] [get_bd_pins MNTZorro_v0_1_S00_AXI_0/VCAP_R1]
connect_bd_net -net VCAP_R2_0_1 [get_bd_ports VCAP_R2] [get_bd_pins MNTZorro_v0_1_S00_AXI_0/VCAP_R2]
connect_bd_net -net VCAP_R3_0_1 [get_bd_ports VCAP_R3] [get_bd_pins MNTZorro_v0_1_S00_AXI_0/VCAP_R3]
connect_bd_net -net VCAP_R4_0_1 [get_bd_ports VCAP_R4] [get_bd_pins MNTZorro_v0_1_S00_AXI_0/VCAP_R4]
connect_bd_net -net VCAP_R5_0_1 [get_bd_ports VCAP_R5] [get_bd_pins MNTZorro_v0_1_S00_AXI_0/VCAP_R5]
connect_bd_net -net VCAP_R6_0_1 [get_bd_ports VCAP_R6] [get_bd_pins MNTZorro_v0_1_S00_AXI_0/VCAP_R6]
connect_bd_net -net VCAP_R7_0_1 [get_bd_ports VCAP_R7] [get_bd_pins MNTZorro_v0_1_S00_AXI_0/VCAP_R7]
connect_bd_net -net VCAP_VSYNC_0_1 [get_bd_ports VCAP_VSYNC] [get_bd_pins MNTZorro_v0_1_S00_AXI_0/VCAP_VSYNC]
connect_bd_net -net ZORRO_C28D_0_1 [get_bd_ports ZORRO_C28D] [get_bd_pins MNTZorro_v0_1_S00_AXI_0/ZORRO_C28D]
connect_bd_net [get_bd_ports ZORRO_DOE] [get_bd_pins MNTZorro_v0_1_S00_AXI_0/ZORRO_DOE]
connect_bd_net [get_bd_ports ZORRO_E7M] [get_bd_pins MNTZorro_v0_1_S00_AXI_0/ZORRO_E7M]
connect_bd_net -net ZORRO_NBGN_0_1 [get_bd_ports ZORRO_NBGN] [get_bd_pins MNTZorro_v0_1_S00_AXI_0/ZORRO_NBGN]
connect_bd_net [get_bd_ports ZORRO_NCCS] [get_bd_pins MNTZorro_v0_1_S00_AXI_0/ZORRO_NCCS]
connect_bd_net [get_bd_ports ZORRO_NCFGIN] [get_bd_pins MNTZorro_v0_1_S00_AXI_0/ZORRO_NCFGIN]
connect_bd_net -net ZORRO_NDS0_1 [get_bd_ports ZORRO_NDS0] [get_bd_pins MNTZorro_v0_1_S00_AXI_0/ZORRO_NDS0]
connect_bd_net -net ZORRO_NDS1_1 [get_bd_ports ZORRO_NDS1] [get_bd_pins MNTZorro_v0_1_S00_AXI_0/ZORRO_NDS1]
connect_bd_net [get_bd_ports ZORRO_NFCS] [get_bd_pins MNTZorro_v0_1_S00_AXI_0/ZORRO_NFCS]
connect_bd_net [get_bd_ports ZORRO_NIORST] [get_bd_pins MNTZorro_v0_1_S00_AXI_0/ZORRO_NIORST]
connect_bd_net [get_bd_ports ZORRO_NLDS] [get_bd_pins MNTZorro_v0_1_S00_AXI_0/ZORRO_NLDS]
connect_bd_net [get_bd_ports ZORRO_NUDS] [get_bd_pins MNTZorro_v0_1_S00_AXI_0/ZORRO_NUDS]
connect_bd_net [get_bd_ports ZORRO_READ] [get_bd_pins MNTZorro_v0_1_S00_AXI_0/ZORRO_READ]
connect_bd_net [get_bd_pins audio_clock_0/bclk_out] \
  [get_bd_ports I2SO_MCLK] [get_bd_pins i2s_receiver_0/sclk_in] [get_bd_pins i2s_transmitter_0/sclk_in]
connect_bd_net [get_bd_pins audio_formatter_0/irq_mm2s] [get_bd_pins xlconcat_0/In1]
connect_bd_net [get_bd_pins audio_formatter_1/irq_s2mm] [get_bd_pins xlconcat_0/In2]
connect_bd_net -net clk_1 [get_bd_pins clk_wiz_0/clk_out1] [get_bd_ports VGA_PCLK] [get_bd_pins video/VGA_PCLK]
connect_bd_net -net clk_wiz_1_mclk_out [get_bd_pins audio_clock_0/mclk_out] \
  [get_bd_pins audio_formatter_0/aud_mclk] [get_bd_pins i2s_receiver_0/aud_mclk] [get_bd_pins i2s_transmitter_0/aud_mclk]
connect_bd_net [get_bd_pins const_zero_mode/dout] [get_bd_pins video/scanlines_mode]
# net gpu_const0_dout has one end: gpu_const0/dout
connect_bd_net [get_bd_pins gpu_const1/dout] [get_bd_pins RasterIX_0/m_cmd_resp_axis_tready] [get_bd_pins RasterIX_0/fb_swapped]
# net gpu_const32_dout has one end: gpu_const32/dout
connect_bd_net [get_bd_pins gpu_magic_const/dout] [get_bd_pins gpu_id_gpio/gpio_io_i]
connect_bd_net [get_bd_pins gpu_version_const/dout] [get_bd_pins gpu_id_gpio/gpio2_io_i]
connect_bd_net [get_bd_pins i2s_transmitter_0/sdata_0_out] [get_bd_ports I2SO_D0]
connect_bd_net -net lrclk_in_0_1 [get_bd_ports I2SO_LRCLK] [get_bd_pins i2s_receiver_0/lrclk_in] [get_bd_pins i2s_transmitter_0/lrclk_in]
connect_bd_net [get_bd_pins proc_sys_reset_0/interconnect_aresetn] [get_bd_pins axi_interconnect_4/ARESETN]
connect_bd_net -net proc_sys_reset_1_peripheral_aresetn [get_bd_pins proc_sys_reset_0/peripheral_aresetn] \
  [get_bd_pins axi_dwidth_converter_0/s_axi_aresetn] [get_bd_pins axi_interconnect_0/ARESETN] \
  [get_bd_pins axi_interconnect_0/M00_ARESETN] [get_bd_pins axi_interconnect_0/S00_ARESETN] \
  [get_bd_pins axi_interconnect_1/ARESETN] [get_bd_pins axi_interconnect_1/M00_ARESETN] \
  [get_bd_pins axi_interconnect_1/S00_ARESETN] [get_bd_pins axi_interconnect_2/ARESETN] \
  [get_bd_pins axi_interconnect_2/M00_ARESETN] [get_bd_pins axi_interconnect_2/S00_ARESETN] \
  [get_bd_pins axi_register_slice_1/aresetn] [get_bd_pins video/aresetn] \
  [get_bd_pins MNTZorro_v0_1_S00_AXI_0/m00_axi_aresetn] [get_bd_pins MNTZorro_v0_1_S00_AXI_0/m01_axi_aresetn] \
  [get_bd_pins MNTZorro_v0_1_S00_AXI_0/S_AXI_ARESETN] [get_bd_pins axi_interconnect_4/M00_ARESETN] \
  [get_bd_pins axi_interconnect_4/S00_ARESETN] [get_bd_pins RasterIX_0/resetn] [get_bd_pins ps7_0_axi_periph/M08_ARESETN] \
  [get_bd_pins gpu_cmd_fifo/s_axi_aresetn]
connect_bd_net [get_bd_pins processing_system7_0/FCLK_CLK0] \
  [get_bd_pins audio_clock_0/fclk_in] [get_bd_pins axi_dwidth_converter_0/s_axi_aclk] [get_bd_pins axi_interconnect_0/ACLK] \
  [get_bd_pins axi_interconnect_0/M00_ACLK] [get_bd_pins axi_interconnect_0/S00_ACLK] [get_bd_pins axi_interconnect_1/ACLK] \
  [get_bd_pins axi_interconnect_1/M00_ACLK] [get_bd_pins axi_interconnect_1/S00_ACLK] [get_bd_pins axi_interconnect_2/ACLK] \
  [get_bd_pins axi_interconnect_2/M00_ACLK] [get_bd_pins axi_interconnect_2/S00_ACLK] [get_bd_pins axi_register_slice_1/aclk] \
  [get_bd_pins clk_wiz_0/clk_in1] [get_bd_pins proc_sys_reset_0/slowest_sync_clk] \
  [get_bd_pins processing_system7_0/M_AXI_GP0_ACLK] [get_bd_pins processing_system7_0/S_AXI_ACP_ACLK] \
  [get_bd_pins processing_system7_0/S_AXI_HP0_ACLK] [get_bd_pins processing_system7_0/S_AXI_HP1_ACLK] \
  [get_bd_pins video/m_axi_mm2s_aclk] [get_bd_pins MNTZorro_v0_1_S00_AXI_0/m00_axi_aclk] \
  [get_bd_pins MNTZorro_v0_1_S00_AXI_0/m01_axi_aclk] [get_bd_pins MNTZorro_v0_1_S00_AXI_0/S_AXI_ACLK] \
  [get_bd_pins processing_system7_0/S_AXI_HP3_ACLK] [get_bd_pins axi_interconnect_4/ACLK] \
  [get_bd_pins axi_interconnect_4/M00_ACLK] [get_bd_pins RasterIX_0/aclk] [get_bd_pins axi_interconnect_4/S00_ACLK] \
  [get_bd_pins ps7_0_axi_periph/M08_ACLK] [get_bd_pins gpu_cmd_fifo/s_axi_aclk]
connect_bd_net [get_bd_pins processing_system7_0/FCLK_RESET0_N] [get_bd_pins proc_sys_reset_0/ext_reset_in]
connect_bd_net [get_bd_pins processing_system7_0/FCLK_RESET1_N] [get_bd_pins rst_ps7_0_25M/ext_reset_in]
connect_bd_net [get_bd_pins rst_ps7_0_25M/peripheral_aresetn] \
  [get_bd_pins audio_formatter_0/m_axis_mm2s_aresetn] [get_bd_pins audio_formatter_0/s_axi_lite_aresetn] \
  [get_bd_pins audio_formatter_1/s_axi_lite_aresetn] [get_bd_pins audio_formatter_1/s_axis_s2mm_aresetn] \
  [get_bd_pins axi_interconnect_3/ARESETN] [get_bd_pins axi_interconnect_3/M00_ARESETN] \
  [get_bd_pins axi_interconnect_3/S00_ARESETN] [get_bd_pins clk_wiz_0/s_axi_aresetn] \
  [get_bd_pins i2s_receiver_0/m_axis_aud_aresetn] [get_bd_pins i2s_receiver_0/s_axi_ctrl_aresetn] \
  [get_bd_pins i2s_transmitter_0/s_axi_ctrl_aresetn] [get_bd_pins i2s_transmitter_0/s_axis_aud_aresetn] \
  [get_bd_pins ps7_0_axi_periph/ARESETN] [get_bd_pins ps7_0_axi_periph/M00_ARESETN] \
  [get_bd_pins ps7_0_axi_periph/M01_ARESETN] [get_bd_pins ps7_0_axi_periph/M02_ARESETN] \
  [get_bd_pins ps7_0_axi_periph/M03_ARESETN] [get_bd_pins ps7_0_axi_periph/M04_ARESETN] \
  [get_bd_pins ps7_0_axi_periph/M05_ARESETN] [get_bd_pins ps7_0_axi_periph/M06_ARESETN] \
  [get_bd_pins ps7_0_axi_periph/S00_ARESETN] [get_bd_pins video/axi_resetn] [get_bd_pins xadc_wiz_0/s_axi_aresetn] \
  [get_bd_pins ps7_0_axi_periph/M07_ARESETN] [get_bd_pins gpu_id_gpio/s_axi_aresetn]
connect_bd_net -net sdata_0_in_0_1 [get_bd_ports I2SI_D0] [get_bd_pins i2s_receiver_0/sdata_0_in]
connect_bd_net -net v_axi4s_vid_out_0_vid_data [get_bd_pins video/dvi_rgb] \
  [get_bd_pins xlslice_0/Din] [get_bd_pins xlslice_1/Din] [get_bd_pins xlslice_2/Din]
connect_bd_net [get_bd_pins video/control_vblank] [get_bd_pins MNTZorro_v0_1_S00_AXI_0/video_control_vblank_in]
connect_bd_net -net video_subsystem_VGA_DE [get_bd_pins video/VGA_DE] [get_bd_ports VGA_DE]
connect_bd_net -net video_subsystem_VGA_HS [get_bd_pins video/VGA_HS] [get_bd_ports VGA_HS]
connect_bd_net -net video_subsystem_VGA_VS [get_bd_pins video/VGA_VS] [get_bd_ports VGA_VS]
connect_bd_net [get_bd_pins xlconcat_0/dout] [get_bd_pins processing_system7_0/IRQ_F2P]
connect_bd_net -net xlconstant_0_dout [get_bd_pins proc_sys_reset_0/peripheral_reset] \
  [get_bd_pins audio_formatter_0/aud_mreset] [get_bd_pins i2s_receiver_0/aud_mrst] [get_bd_pins i2s_transmitter_0/aud_mrst]
connect_bd_net [get_bd_pins xlslice_0/Dout] [get_bd_ports VGA_R]
connect_bd_net [get_bd_pins xlslice_1/Dout] [get_bd_ports VGA_G]
connect_bd_net [get_bd_pins xlslice_2/Dout] [get_bd_ports VGA_B]

# ---- address map ----
assign_bd_address -offset 0x00000000 -range 1G -target_address_space [get_bd_addr_spaces audio_formatter_0/m_axi_mm2s] [get_bd_addr_segs processing_system7_0/S_AXI_HP2/HP2_DDR_LOWOCM]
assign_bd_address -offset 0x00000000 -range 1G -target_address_space [get_bd_addr_spaces MNTZorro_v0_1_S00_AXI_0/m00_axi] [get_bd_addr_segs processing_system7_0/S_AXI_ACP/ACP_DDR_LOWOCM]
assign_bd_address -offset 0x40000000 -range 1G -target_address_space [get_bd_addr_spaces MNTZorro_v0_1_S00_AXI_0/m00_axi] [get_bd_addr_segs processing_system7_0/S_AXI_ACP/ACP_M_AXI_GP0]
assign_bd_address -offset 0x80000000 -range 1G -target_address_space [get_bd_addr_spaces MNTZorro_v0_1_S00_AXI_0/m00_axi] [get_bd_addr_segs processing_system7_0/S_AXI_ACP/ACP_M_AXI_GP1]
assign_bd_address -offset 0xE0000000 -range 4M -target_address_space [get_bd_addr_spaces MNTZorro_v0_1_S00_AXI_0/m00_axi] [get_bd_addr_segs processing_system7_0/S_AXI_ACP/ACP_IOP]
assign_bd_address -offset 0x00000000 -range 1G -target_address_space [get_bd_addr_spaces MNTZorro_v0_1_S00_AXI_0/m01_axi] [get_bd_addr_segs processing_system7_0/S_AXI_HP1/HP1_DDR_LOWOCM]
assign_bd_address -offset 0x43C00000 -range 64K -target_address_space [get_bd_addr_spaces processing_system7_0/Data] [get_bd_addr_segs MNTZorro_v0_1_S00_AXI_0/S_AXI/reg0]
assign_bd_address -offset 0x83000000 -range 64K -target_address_space [get_bd_addr_spaces processing_system7_0/Data] [get_bd_addr_segs video/axi_vdma_0/S_AXI_LITE/Reg]
assign_bd_address -offset 0x83C00000 -range 64K -target_address_space [get_bd_addr_spaces processing_system7_0/Data] [get_bd_addr_segs clk_wiz_0/s_axi_lite/Reg]
assign_bd_address -offset 0x83C10000 -range 64K -target_address_space [get_bd_addr_spaces processing_system7_0/Data] [get_bd_addr_segs xadc_wiz_0/s_axi_lite/Reg]
assign_bd_address -offset 0x83C20000 -range 64K -target_address_space [get_bd_addr_spaces processing_system7_0/Data] [get_bd_addr_segs audio_formatter_0/s_axi_lite/reg0]
assign_bd_address -offset 0x83C30000 -range 64K -target_address_space [get_bd_addr_spaces processing_system7_0/Data] [get_bd_addr_segs i2s_transmitter_0/s_axi_ctrl/Reg]
assign_bd_address -offset 0x83C40000 -range 64K -target_address_space [get_bd_addr_spaces processing_system7_0/Data] [get_bd_addr_segs i2s_receiver_0/s_axi_ctrl/Reg]
assign_bd_address -offset 0x83C50000 -range 64K -target_address_space [get_bd_addr_spaces processing_system7_0/Data] [get_bd_addr_segs audio_formatter_1/s_axi_lite/reg0]
assign_bd_address -offset 0x83C60000 -range 64K -target_address_space [get_bd_addr_spaces processing_system7_0/Data] [get_bd_addr_segs gpu_id_gpio/S_AXI/Reg]
assign_bd_address -offset 0x83C70000 -range 64K -target_address_space [get_bd_addr_spaces processing_system7_0/Data] [get_bd_addr_segs gpu_cmd_fifo/S_AXI/Mem0]
assign_bd_address -offset 0x06600000 -range 2M -target_address_space [get_bd_addr_spaces RasterIX_0/m_axi] [get_bd_addr_segs processing_system7_0/S_AXI_HP3/HP3_DDR_LOWOCM]
assign_bd_address -offset 0x00000000 -range 1G -target_address_space [get_bd_addr_spaces video/axi_vdma_0/Data_MM2S] [get_bd_addr_segs processing_system7_0/S_AXI_HP0/HP0_DDR_LOWOCM]

validate_bd_design
save_bd_design
